# Altium project Sound_Sensor_PoE_v3.2.PrjPcb (part 4 of 4)
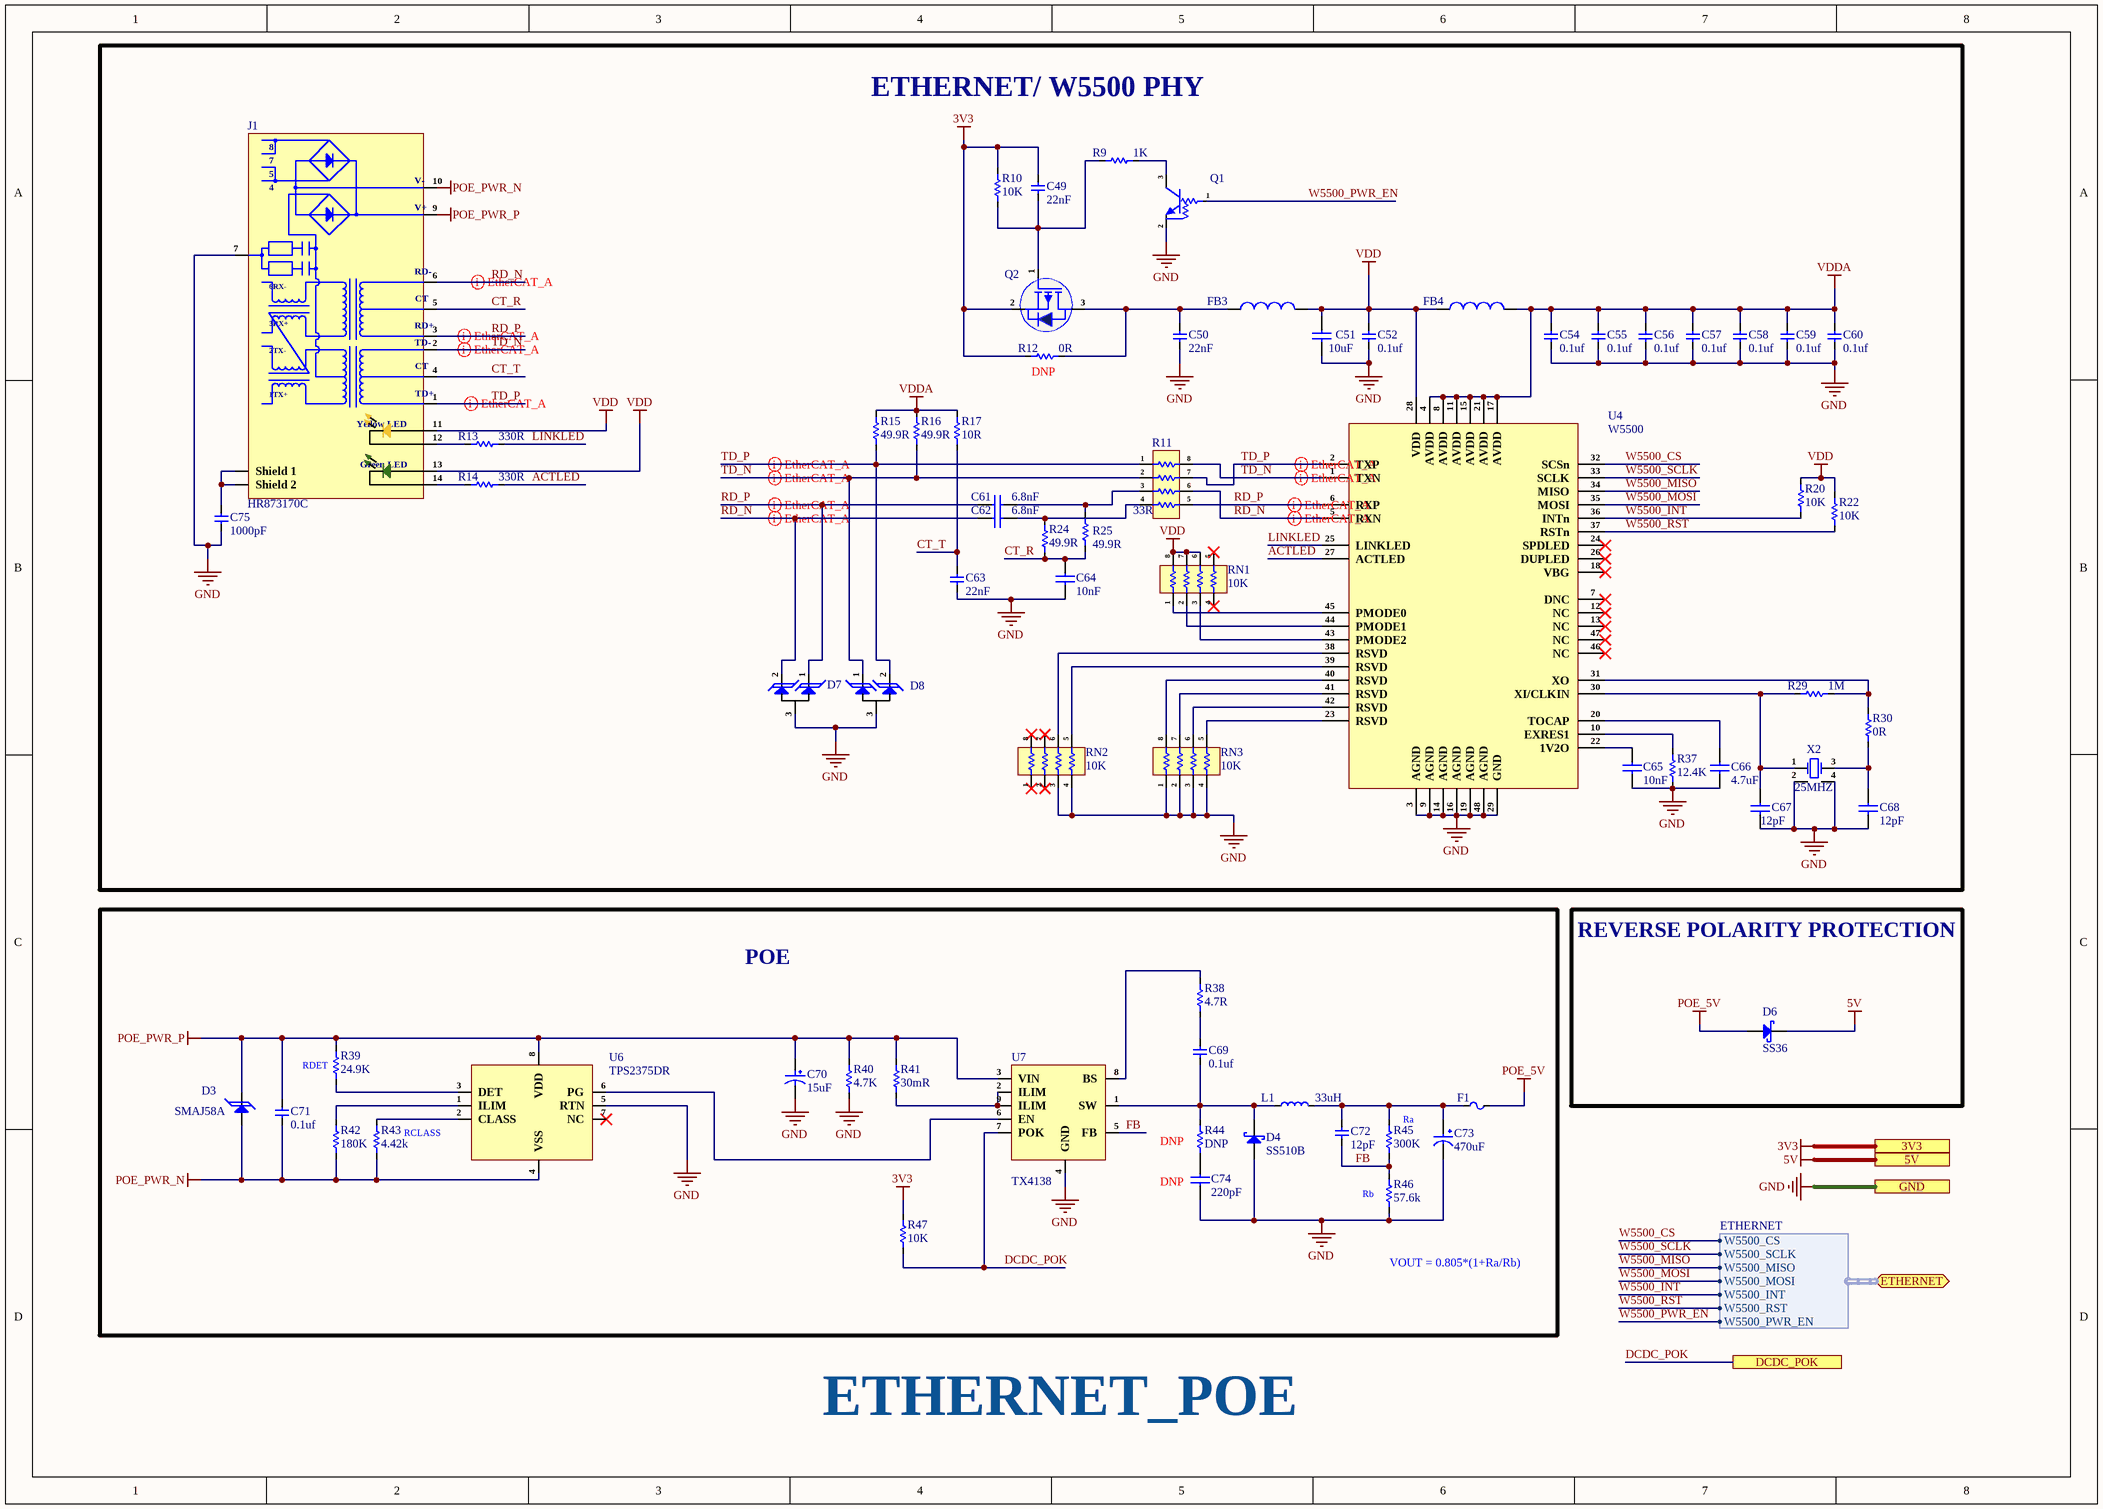
[diagram p8: Ethernet_PoE.SchDoc]

## Sheet Ethernet_PoE.SchDoc (continued)

### Library data of the parts (continued)
RN1-RN3 = YC164-FR-0710KL: RES ARRAY 4 RES 10K OHM 1206; Manufacturer: Yageo; Tolerance: 1%; Voltage Rating: 50V; Number of Elements: 4; Value: 10kR; Circuit Type: Isolated; Power Per Element: 62.5mW; Temperature Coefficient: 200ppm/°C; Item Type: Resistor Array; Supplier 1: Future Electronics; Manufacturer Part Number: YC164-FR-0710KL; RoHS: Yes; Category: Resistor Arrays; Stock 1: 25000; Pricing 1: 5000=0.0101, 20000=0.0095, 50000=0.0092, 125000=0.0089, 200000=0.0085 (USD); Mounting Technology: Surface Mount; Pins: 8; Case Code (Metric): 3216; Case Code (Imperial): 1206; Min Operating Temperature: -55°C; Max Operating Temperature: 155°C; Packaging: Tape and Reel; Number of Resistors: 4; Number of Circuits: 4; Series: YC164; Resistance Tolerance: 1%; Length: 0.126inch; Width: 0.063inch; Height: 0.028inch; Lead Free: Lead Free; RoHS Compliant: Yes; Reach SVHC Compliant: Unknown; ComponentLink1URL: http://www.farnell.com/datasheets/2167431.pdf?src-supplier=Farnell; ComponentLink1Description: http://www.farnell.com/datasheets/2167431.pdf?src-supplier=Farnell; ComponentLink2URL: https://media.digikey.com/pdf/Data%20Sheets/Yageo%20PDFs/YC102-358,TC122-164_Series_DS.pdf?src-supplier=Digi-Key; ComponentLink2Description: https://media.digikey.com/pdf/Data%20Sheets/Yageo%20PDFs/YC102-358,TC122-164_Series_DS.pdf?src-supplier=Digi-Key; ComponentLink3URL: http://www.farnell.com/datasheets/2167431.pdf?src-supplier=Element14; ComponentLink3Description: http://www.farnell.com/datasheets/2167431.pdf?src-supplier=Element14; ComponentLink4URL: http://www.farnell.com/datasheets/443424.pdf?src-supplier=Element14; ComponentLink4Description: http://www.farnell.com/datasheets/443424.pdf?src-supplier=Element14; ComponentLink5URL: http://www.farnell.com/datasheets/2167431.pdf?src-supplier=Newark; ComponentLink5Description: http://www.farnell.com/datasheets/2167431.pdf?src-supplier=Newark; Supplier Part Number 1: 5054288; LCSC Part Number: C110924
U4 = W5500: SPI LQFP-48(7x7) Ethernet ICs ROHS; Manufacturer: WIZNET; Item Type: IC; Manufacturer Part Number: W5500; LCSC Part Number: C32843; Package: LQFP-48(7x7); ComponentLink1Description: LCSC; ComponentLink1URL: https://www.lcsc.com/product-detail/Ethernet-ICs_WIZNET-W5500_C32843.html
U6 = TPS2375DR: IC POE CNTRL 1 CHANNEL 8SOIC; Manufacturer: Texas Instruments; Max Power Dissipation: 12.95W; Operating Supply Current: 240uA; Min Current Limit: 405mA; Output Current: 450mA; Number of Channels: 1; Max Supply Voltage: 57V; Min Supply Voltage: 0V; Power Dissipation: 13W; Supplier 1: Mouser; Manufacturer Part Number: TPS2375DR; RoHS: Yes; Category: Interface ICs; Stock 1: 12566; Pricing 1: 1=2.94, 10=2.65, 50=2.5, 100=2.13, 1000=1.45, 10000=1.29 (USD); Case/Package: D; Pins: 8; Weight: 0.002561oz; Min Operating Temperature: -40°C; Max Operating Temperature: 85°C; Packaging: Tape and Reel; Package Quantity: 2500; Series: -; Length: 5mm; Height: 1.58mm; Radiation Hardening: No; Lead Free: Lead Free; RoHS Compliant: Yes; ComponentLink1URL: https://datasheet.ciiva.com/1943/tps2375-1943071.pdf?src-supplier=Digi-Key; ComponentLink1Description: https://datasheet.ciiva.com/1943/tps2375-1943071.pdf?src-supplier=Digi-Key; ComponentLink2URL: https://datasheet.ciiva.com/1943/tps2375-1943070.pdf?src-supplier=Digi-Key; ComponentLink2Description: https://datasheet.ciiva.com/1943/tps2375-1943070.pdf?src-supplier=Digi-Key; ComponentLink3URL: https://datasheet.ciiva.com/1943/tps2375-1943072.pdf?src-supplier=Digi-Key; ComponentLink3Description: https://datasheet.ciiva.com/1943/tps2375-1943072.pdf?src-supplier=Digi-Key; ComponentLink4URL: https://datasheet.ciiva.com/14248/tps2375-14248055.pdf?src-supplier=Avnet; ComponentLink4Description: https://datasheet.ciiva.com/14248/tps2375-14248055.pdf?src-supplier=Avnet; Supplier Part Number 1: 595-TPS2375DR; LCSC Part Number: C2867397; Item Type: IC
U7 = TX4138: Step-down type SOIC-8-EP DC-DC Converters ROHS; Manufacturer: XDS; Item Type: IC; Manufacturer Part Number: TX4138; Package: SOIC-8-EP; LCSC Part Number: C329267; ComponentLink1Description: LCSC; ComponentLink1URL: https://www.lcsc.com/product-detail/DC-DC-Converters_XDS-TX4138_C329267.html
X2 = NX3225GA-25MHZ-STD-CRG-2: SMD3225-4P Crystals ROHS; Manufacturer: NDK; Manufacturer Part Number: NX3225GA-25MHZ-STD-CRG-2; Package: SMD3225-4P; LCSC Part Number: C438901; Item Type: Crystal; ComponentLink1Description: LCSC; ComponentLink1URL: https://www.lcsc.com/product-detail/Crystals_NDK-NX3225GA-25MHZ-STD-CRG-2_C438901.html

## Nets that join several sheets
3V3: Sensor_Sheet (24 pins), Power_Section (C2.1 FB2.2), Connector_Sheet (J3.1), ADC_Section (9 pins), Controller_Sheet (6 pins), Ethernet_PoE (5 pins)
5V: Power_Section (C1.1 U1.1 U1.3), Connector_Sheet (C47.1 D5.1), Ethernet_PoE (D6.1)
GND: Sensor_Sheet (40 pins), Power_Section (C1.2 C2.2 U1.2), Connector_Sheet (12 pins), ADC_Section (13 pins), Controller_Sheet (11 pins), Ethernet_PoE (45 pins)
~{CS}: ADC_Section (R4.1 U2.17), Controller_Sheet (U3.21)
~{DRDY}: ADC_Section (R5.1 U2.18), Controller_Sheet (U3.17)
~{RESET}: ADC_Section (R3.1 U2.16), Controller_Sheet (U3.18)
DCDC_POK: Controller_Sheet (U3.8), Ethernet_PoE (R47.1 U7.7)
DEBUG SIG.ENABLE: Connector_Sheet (J3.6), Controller_Sheet (5 pins)
DEBUG SIG.IO_0: Connector_Sheet (J3.5), Controller_Sheet (U3.27)
DEBUG SIG.RX: Connector_Sheet (J3.4), Controller_Sheet (U3.36)
DEBUG SIG.TX: Connector_Sheet (J3.3), Controller_Sheet (U3.37)
MIC_OUTS.OUT1_N: Sensor_Sheet (MK1.6), ADC_Section (C32.1)
MIC_OUTS.OUT1_P: Sensor_Sheet (MK1.1), ADC_Section (C31.1)
MIC_OUTS.OUT2_N: Sensor_Sheet (MK2.6), ADC_Section (C33.1)
MIC_OUTS.OUT2_P: Sensor_Sheet (MK2.1), ADC_Section (C34.1)
MIC_OUTS.OUT3_N: Sensor_Sheet (MK3.6), ADC_Section (C20.1)
MIC_OUTS.OUT3_P: Sensor_Sheet (MK3.1), ADC_Section (C19.1)
MIC_OUTS.OUT4_N: Sensor_Sheet (MK4.6), ADC_Section (C21.1)
MIC_OUTS.OUT4_P: Sensor_Sheet (MK4.1), ADC_Section (C22.1)
MIC_OUTS.OUT5_N: Sensor_Sheet (MK5.6), ADC_Section (C24.1)
MIC_OUTS.OUT5_P: Sensor_Sheet (MK5.1), ADC_Section (C23.1)
MIC_OUTS.OUT6_N: Sensor_Sheet (MK6.6), ADC_Section (C25.1)
MIC_OUTS.OUT6_P: Sensor_Sheet (MK6.1), ADC_Section (C26.1)
MIC_OUTS.OUT7_N: Sensor_Sheet (MK7.6), ADC_Section (C28.1)
MIC_OUTS.OUT7_P: Sensor_Sheet (MK7.1), ADC_Section (C27.1)
MIC_OUTS.OUT8_N: Sensor_Sheet (MK8.6), ADC_Section (C29.1)
MIC_OUTS.OUT8_P: Sensor_Sheet (MK8.1), ADC_Section (C30.1)
MISO: ADC_Section (U2.20), Controller_Sheet (U3.20)
MOSI: ADC_Section (U2.21), Controller_Sheet (U3.19)
SCLK: ADC_Section (U2.19), Controller_Sheet (U3.22)
USB.USB_N: Connector_Sheet (J2.A7 J2.B7), Controller_Sheet (U3.13)
USB.USB_P: Connector_Sheet (J2.A6 J2.B6), Controller_Sheet (U3.14)
W5500_CS: Controller_Sheet (U3.5), Ethernet_PoE (U4.32)
W5500_INT: Controller_Sheet (U3.39), Ethernet_PoE (R20.1 U4.36)
W5500_MISO: Controller_Sheet (U3.7), Ethernet_PoE (U4.34)
W5500_MOSI: Controller_Sheet (U3.12), Ethernet_PoE (U4.35)
W5500_PWR_EN: Controller_Sheet (U3.4), Ethernet_PoE (Q1.1)
W5500_RST: Controller_Sheet (U3.38), Ethernet_PoE (R22.1 U4.37)
W5500_SCLK: Controller_Sheet (U3.6), Ethernet_PoE (U4.33)